# Altium schematic sheet Schematic.SchDoc
size A2; SheetNumber: 1; SheetTotal: 1
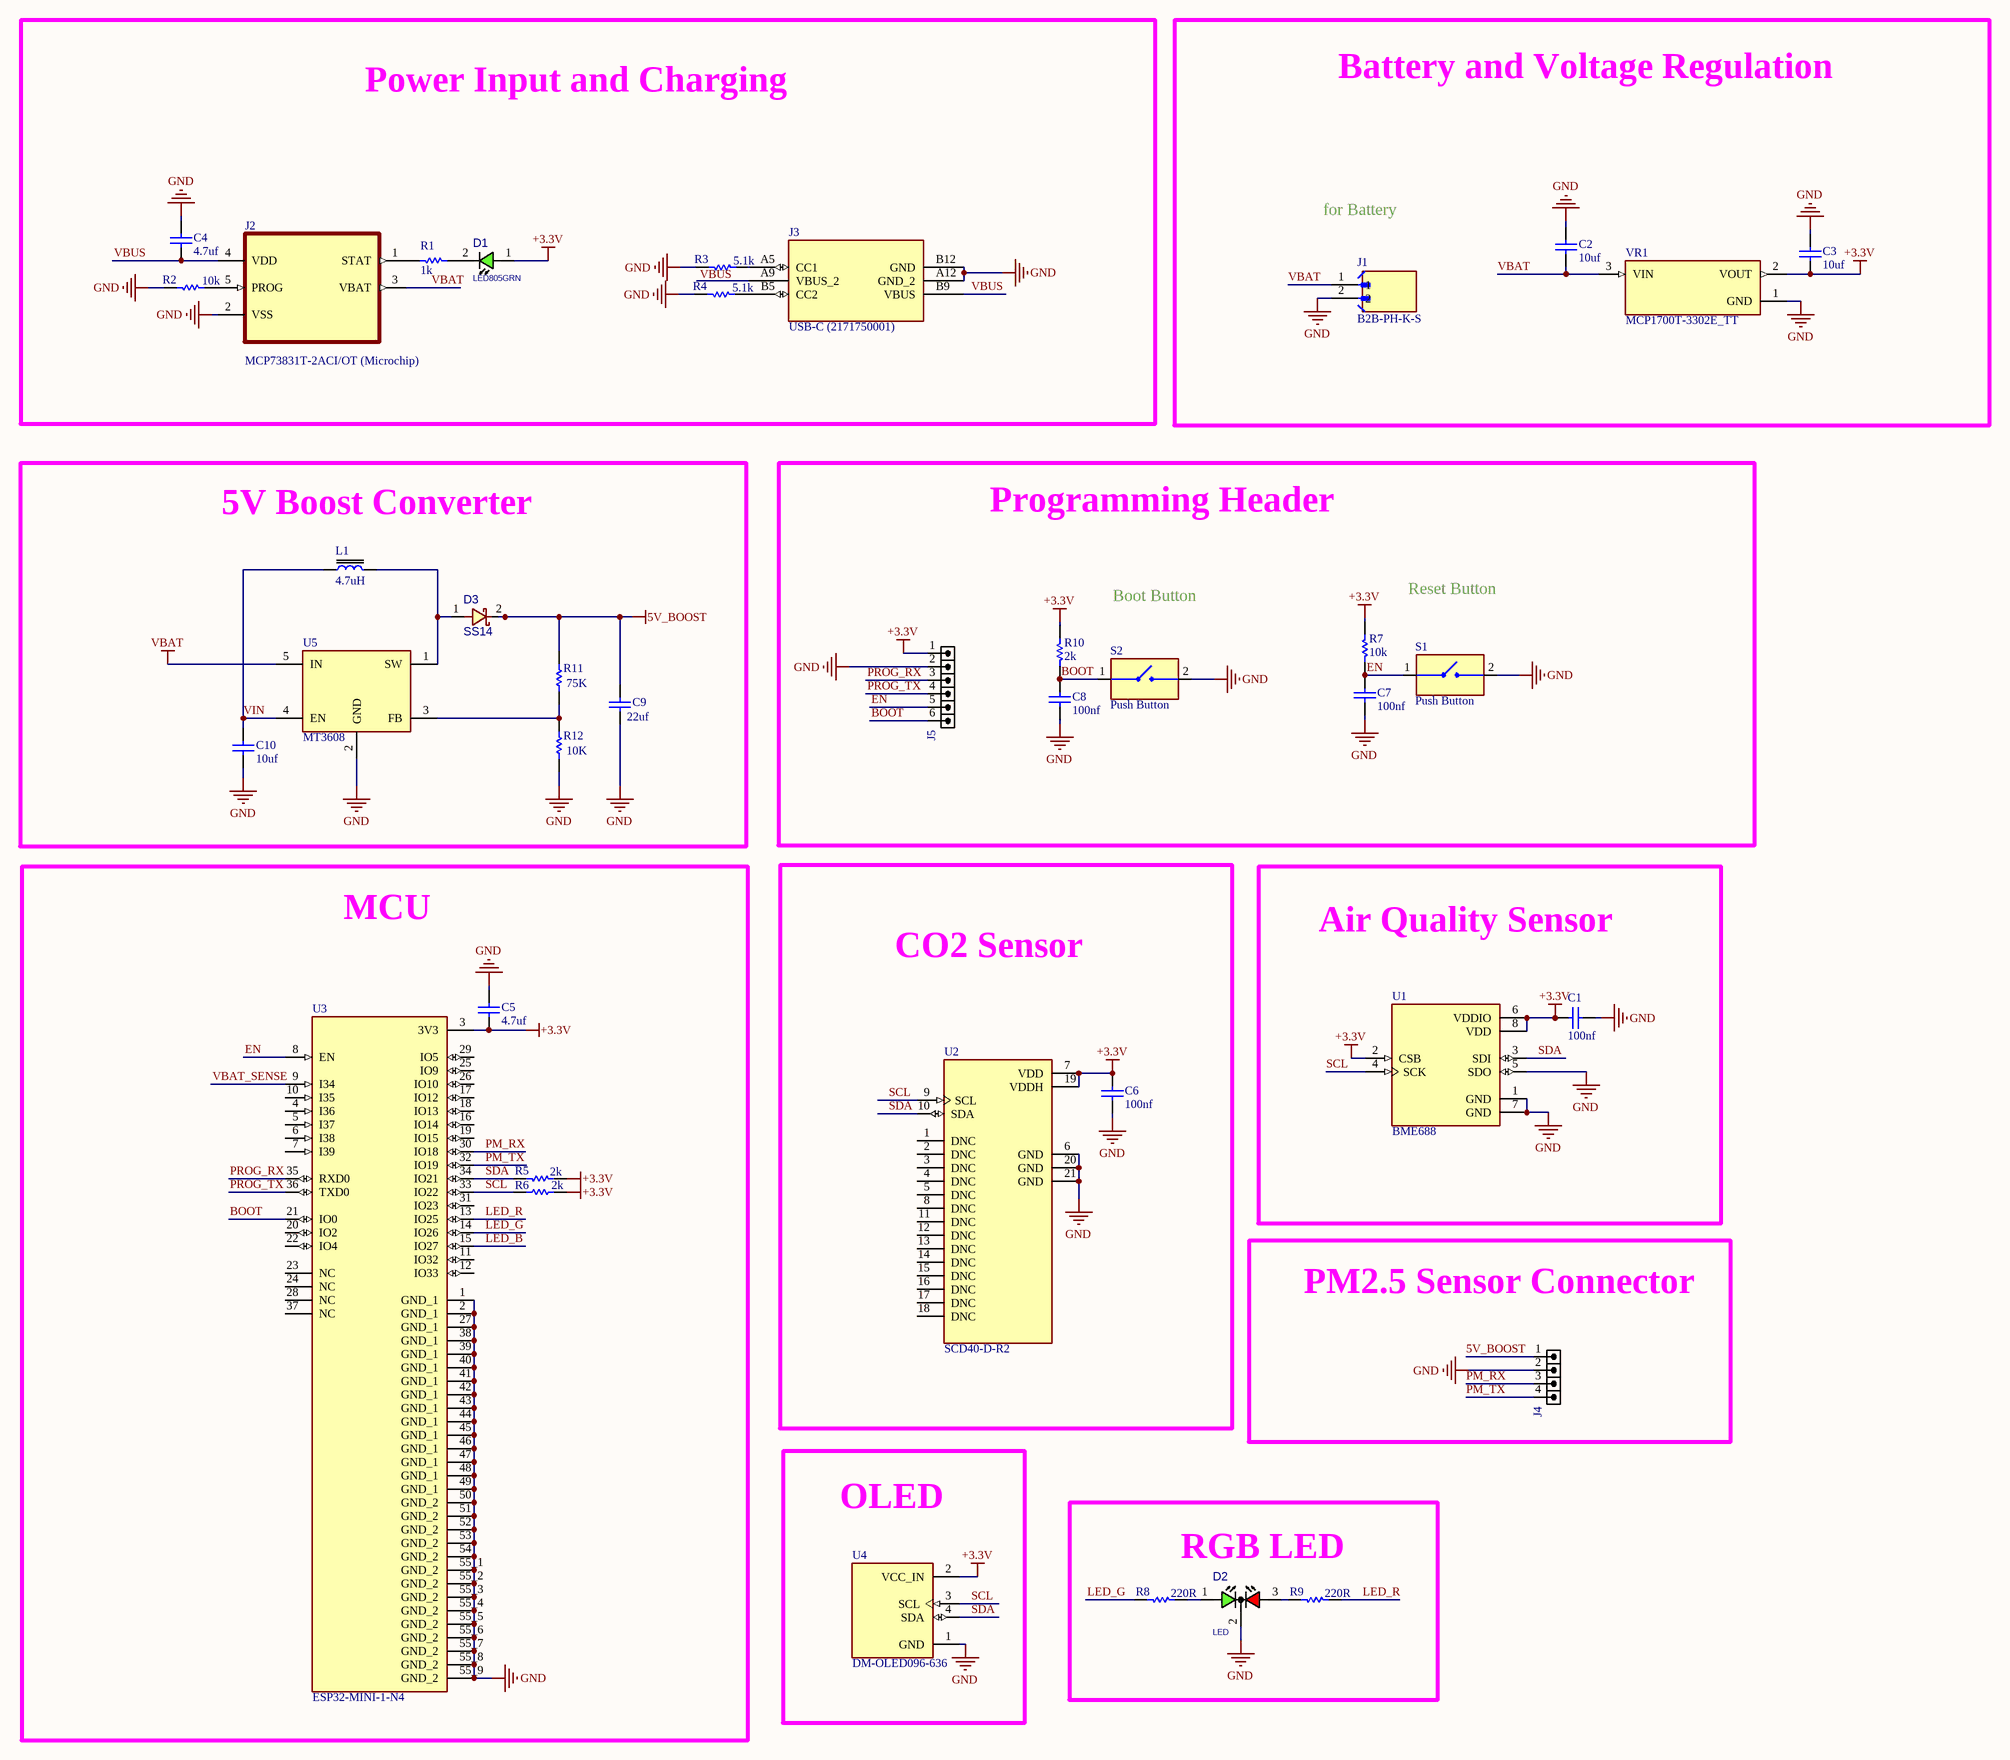
[diagram p0: Schematic.SchDoc]

## Parts
C1  100nf  [CAP0805]
C2  10uf  [CAP0805]
C3  10uf  [CAP0805]
C4  4.7uf  [CAP0805]
C5  4.7uf  [CAP0805]
C6  100nf  [CAP0805]
C7  100nf  [CAP0805]
C8  100nf  [CAP0805]
C9  22uf  [CAP1206]
C10  10uf  [CAP1206]
D1  LED805GRN  [LED0805GRN]
D2  LED  [LED3BI]
D3  SS14  [CAP0805]
J1  B2B-PH-K-S  [JST_B2B-PH-K-S]
J2  MCP73831T-2ACI/OT (Microchip)  [SOT95P280X145-5N]
J3  USB-C (2171750001)  [2171750001_MOL]
J4  HDR1X4  [HDR_M_1X4]  (value not drawn)
J5  HDR1X6  [HDR_M_1X6]  (value not drawn)
L1  4.7uH  [RES1210]
R1  1k  [RES0805]
R2  10k  [RES0805]
R3  5.1k  [RES0805]
R4  5.1k  [RES0805]
R5  2k  [RES0805]
R6  2k  [RES0805]
R7  10k  [RES0805]
R8  220R  [RES0805]
R9  220R  [RES0805]
R10  2k  [RES0805]
R11  75K  [RES0805]
R12  10K  [RES0805]
S1  Push Button  [SW_1437566-4]
S2  Push Button  [SW_1437566-4]
U1  BME688  [IC_BME688]
U2  SCD40-D-R2  [XDCR_SCD40-D-R2]
U3  ESP32-MINI-1-N4  [XCVR_ESP32-MINI-1-N4]
U4  DM-OLED096-636  [MODULE_DM-OLED096-636]
U5  MT3608  [TI SOT-23-6 DBV]
VR1  MCP1700T-3302E_TT  [SOT95P237X112-3N]

## Blocks framed on the sheet
Power Input and Charging: C4 D1 J2 J3 R1-R4
Battery and Voltage Regulation: C2 C3 J1 VR1
5V Boost Converter: C9 C10 D3 L1 R11 R12 U5
Programming Header: C7 C8 J5 R7 R10 S1 S2
MCU: C5 R5 R6 U3
CO2 Sensor: C6 U2
Air Quality Sensor: C1 U1
PM2.5 Sensor Connector: J4
OLED: U4
RGB LED: D2 R8 R9

## Nets
5V_BOOST: C9.1 D3.2 J4.1 R11.2
+3.3V: C1.1 C3.2 C5.1 C6.1 D1.1(ANODE) J5.1 R5.1 R6.1 R7.1 R10.1 U1.2(CSB) U1.6(VDDIO) U1.8(VDD) U2.7(VDD) U2.19(VDDH) U3.3(3V3) U4.2(VCC_IN) VR1.2(VOUT)
GND: C1.2 C2.1 C3.1 C4.2 C5.2 C6.2 C7.2 C8.2 C9.2 C10.2 D2.2(C) J1.2 J2.2(VSS) J3.A12(GND_2) J3.B12(GND) J4.2 J5.2 R2.2 R3.2 R4.2 R12.1 S1.2 S2.2 U1.1(GND) U1.5(SDO) U1.7(GND) U2.6(GND) U2.20(GND) U2.21(GND) U3.1(GND_1) U3.2(GND_1) U3.27(GND_1) U3.38(GND_1) U3.39(GND_1) U3.40(GND_1) U3.41(GND_1) U3.42(GND_1) U3.43(GND_1) U3.44(GND_1) U3.45(GND_1) U3.46(GND_1) U3.47(GND_1) U3.48(GND_1) U3.49(GND_1) U3.50(GND_2) U3.51(GND_2) U3.52(GND_2) U3.53(GND_2) U3.54(GND_2) U3.55_1(GND_2) U3.55_2(GND_2) U3.55_3(GND_2) U3.55_4(GND_2) U3.55_5(GND_2) U3.55_6(GND_2) U3.55_7(GND_2) U3.55_8(GND_2) U3.55_9(GND_2) U4.1(GND) U5.2(GND) VR1.1(GND)
VBAT: C2.2 J1.1 J2.3(VBAT) U5.5(IN) VR1.3(VIN)
BOOT: C8.1 J5.6 R10.2 S2.1 U3.21(IO0)
EN: C7.1 J5.5 R7.2 S1.1 U3.8(EN)
LED_B: U3.15(IO27)
LED_G: R8.2 U3.14(IO26)
LED_R: R9.1 U3.13(IO25)
PM_RX: J4.3 U3.30(IO18)
PM_TX: J4.4 U3.32(IO19)
PROG_RX: J5.3 U3.35(RXD0)
PROG_TX: J5.4 U3.36(TXD0)
SCL: R6.2 U1.4(SCK) U2.9(SCL) U3.33(IO22) U4.3(SCL)
SDA: R5.2 U1.3(SDI) U2.10(SDA) U3.34(IO21) U4.4(SDA)
VBAT_SENSE: U3.9(I34)
VBUS: C4.1 J2.4(VDD) J3.B9(VBUS)
VIN: C10.1 L1.1 U5.4(EN)
NetD1_2: D1.2(CATHODE) R1.1
NetD2_1: D2.1(RED) R8.1
NetD2_3: D2.3(GRN) R9.2
NetD3_1: D3.1 L1.2 U5.1(SW)
NetJ2_1: J2.1(STAT) R1.2
NetJ2_5: J2.5(PROG) R2.1
NetJ3_A5: J3.A5(CC1) R3.1
NetJ3_B5: J3.B5(CC2) R4.1
NetR11_1: R11.1 R12.2 U5.3(FB)

Not connected (* = marked no-connect by the designer): J3 A9(VBUS_2); U2 1(DNC) 2(DNC) 3(DNC) 4(DNC) 5(DNC) 8(DNC) 11(DNC) 12(DNC) 13(DNC) 14(DNC) 15(DNC) 16(DNC) 17(DNC) 18(DNC); U3 4(I36) 5(I37) 6(I38) 7(I39) 10(I35) 11(IO32) 12(IO33) 16(IO14) 17(IO12) 18(IO13) 19(IO15) 20(IO2) 22(IO4) 23(NC) 24(NC) 25(IO9) 26(IO10) 28(NC) 29(IO5) 31(IO23) 37(NC)

## Notes on the sheet
- for Battery
- Boot Button
- Reset Button
- Labels drawn without touching a wire or pin: VBUS

## Library data of the parts
C1-C8 = Capacitor SMD: Seller: javan electronic; Manufacture: www.novaday.ir; Purchase Link1: https://www.javanelec.com/Shops/ProductDetail/4196?part_number=1UF%20%280805%29%2050V%2010%25%20X7R; Purchase Link2: https://kaelectronic.ir/index.php?route=product/product&product_id=5502&search=1UF
  C1 C6-C8: Value: 100nf
  C2 C3: Value: 10uf
  C4 C5: Value: 4.7uf
C9 C10 = Capacitor Ceramic: Seller: javan electronic; Manufacture: www.novaday.ir; Purchase Link1: https://www.javanelec.com/Shops?productCategory=1128#dtl/5328
  C9: Value: 22uf
  C10: Value: 10uf
D1 = LED_SMD_0805_GRN: LED, SMD, 0805, GREEN; Seller: javan electronic; Value: LED805GRN; Manufacture: www.novaday.ir; Purchase Link1: https://www.javanelec.com/Shops/ProductDetail/11924?part_number=LED%20%280805%29%20G
D2 = LED_THD_BICOLOR_RG_CC3: LED, THD, 3MM, BICOLOR CC GRNRED; MANF_P#: WP3VSURKCGKW; MANF: kingbright; DESC: DESCRIPTION; ASSEMBLY: ASSEMBLY; PRICE: PRICE; VALUE: LED
D3 = DIODE_SMD_SCHOTTKY_SS34: Seller: javan electronic; Value: SS14; Manufacture: www.novaday.ir; Purchase Link1: https://www.javanelec.com/Shops?searchFilter=5822#dtl/626
J1 = B2B-PH-K-S: Connector Header Through Hole 2 position 0.079 (2.00mm); MF: JST Sales America Inc.; SnapEDA_Link: https://www.snapeda.com/parts/B2B-PH-K-S/JST/view-part/?ref=snap; Package: None; Value: *; MP: B2B-PH-K-S; Check_prices: https://www.snapeda.com/parts/B2B-PH-K-S/JST/view-part/?ref=eda
J2 = MCP73831T-2ACI/OT: Charger IC Lithium Ion/Polymer SOT-23-5; MF: Microchip; Package: SOT-23 Microchip; Purchase-URL: https://pricing.snapeda.com/search/part/MCP73831T-2ACI/OT/?ref=eda; MP: MCP73831T-2ACI/OT; Value: *; Availability: In Stock; SnapEDA_Link: https://www.snapeda.com/parts/MCP73831T-2ACI/OT/Microchip/view-part/?ref=snap; Price: None; Check_prices: https://www.snapeda.com/parts/MCP73831T-2ACI/OT/Microchip/view-part/?ref=eda
J3 = 2171750001: USB-C (USB TYPE-C) USB 2.0 Receptacle Connector 24 (6+18 Dummy) Position Surface Mount, Right Angle; Through HoleÄáº§u ná»‘i á»• cáº¯m USB 2.0 USB-C (USB TYPE-C) 24 (6 + 18 giáº£) Vá»‹ trÃ­ GiÃ¡ treo bá» máº·t, gÃ³c pháº£i; ThÃ´ng qua lá»—; MF: Molex; SnapEDA_Link: https://www.snapeda.com/parts/2171750001/Molex/view-part/?ref=snap; Package: None; Value: *; MP: 2171750001; Check_prices: https://www.snapeda.com/parts/2171750001/Molex/view-part/?ref=eda
J4 = HDR_M_1X4: CONN, HEADER, Male, pitch: 2.54mm, 4POS; VALUE: HDRM4
J5 = HDR_M_1X6: CONN, HEADER, Male, pitch: 2.54mm, 6POS; VALUE: HDRM6
L1 = IND-NR6045-22UH: Seller: javan electronic; Purchase Link1: https://www.javanelec.com/Shops?searchFilter=6045#dtl/12927; Value: 4.7uH
R1-R10 R12 = Resistor: Seller: javan electronic; Manufacture: www.novaday.ir
  R1: Value: 1k; Purchase Link1: https://www.javanelec.com/Shops?productCategory=866#dtl/4027
  R2 R7: Value: 10k; Purchase Link1: https://www.javanelec.com/Shops?productCategory=866#dtl/4027
  R3 R4: Value: 5.1k; Purchase Link1: https://www.javanelec.com/Shops?productCategory=866#dtl/4027
  R5 R6 R10: Value: 2k; Purchase Link1: https://www.javanelec.com/Shops?productCategory=866#dtl/4027
  R8 R9: Value: 220R; Purchase Link1: https://www.javanelec.com/Shops?productCategory=866#dtl/4027
  R12: Value: 10K; Purchase Link1: https://www.javanelec.com/Shops?productCategory=866#dtl/17311
R11 = Resistor: ""Both links should be purchased.""; Seller: javan electronic; Value: 75K; Manufacture: www.novaday.ir; Purchase Link1: https://www.javanelec.com/Shops?productCategory=866#dtl/3977
S1 S2 = 1437566-4: FSMSMTR=TACT SWITCH SPST-NO; Contact_Current_Rating: 50 mA; Configuration_Pole-Throw: Single Pole - Single Throw; MF: TE Connectivity; SnapEDA_Link: https://www.snapeda.com/parts/1437566-4/TE+Connectivity+Alcoswitch+Switches/view-part/?ref=snap; Package: None; Value: *; MP: 1437566-4; Check_prices: https://www.snapeda.com/parts/1437566-4/TE+Connectivity+Alcoswitch+Switches/view-part/?ref=eda
U1 = BME688: Gas sensor measuring relative humidity, barometric pressure, ambient temperature and gas (VOC); Package: None; MP: BME688; Price: None; Availability: Unavailable; Value: *
U2 = SCD40-D-R2: Air Quality Sensor CO2 Sensor 2.5V/3.3V/5V 20-Pin SMD EP; MF: Sensirion AG; SnapEDA_Link: https://www.snapeda.com/parts/SCD40-D-R2/Sensirion+AG/view-part/?ref=snap; Package: None; Value: *; MP: SCD40-D-R2; Check_prices: https://www.snapeda.com/parts/SCD40-D-R2/Sensirion+AG/view-part/?ref=eda
U3 = ESP32-MINI-1-N4: Bluetooth, WiFi 802.11b/g/n, Bluetooth v4.2 +EDR, Class 1, 2 and 3 Transceiver Module 2.412GHz ~ 2.484GHz Integrated, Trace Chassis Mount; MF: Espressif Systems; SnapEDA_Link: https://www.snapeda.com/parts/ESP32-MINI-1-N4/Espressif+Systems/view-part/?ref=snap; Package: Module Espressif Systems; Value: *; MP: ESP32-MINI-1-N4; Check_prices: https://www.snapeda.com/parts/ESP32-MINI-1-N4/Espressif+Systems/view-part/?ref=eda
U4 = DM-OLED096-636: 0.96â€ 128 X 64 MONOCHROME GRAPHIC OLED DISPLAY MODULE - I2C; SnapEDA_Link: https://www.snapeda.com/parts/DM-OLED096-636/Display+Module/view-part/?ref=snap; Package: Package; Value: *; MF: Display Module; MP: DM-OLED096-636; Check_prices: https://www.snapeda.com/parts/DM-OLED096-636/Display+Module/view-part/?ref=eda
U5 = MT3608: Seller: Shopping is offline; Value: MT3608; Manufacture: www.novaday.ir; Purchase Link1: https://digighate.com/product/MT3608
VR1 = MCP1700T-3302E_TT: Pwr Sply Func,Voltage Regulator,LDO,SOT-23,PD 369.6mW,VO 3.3V,Regline +/-0.75%/V | Microchip Technology Inc. MCP1700T-3302E/TT; SnapEDA_Link: https://www.snapeda.com/parts/MCP1700T-3302E/TT/Microchip/view-part/?ref=snap; Package: SOT-23 Microchip; Value: *; MF: Microchip; MP: MCP1700T-3302E/TT; Check_prices: https://www.snapeda.com/parts/MCP1700T-3302E/TT/Microchip/view-part/?ref=eda